# EAGLE design team throttle control (EAGLE 9.6.2)
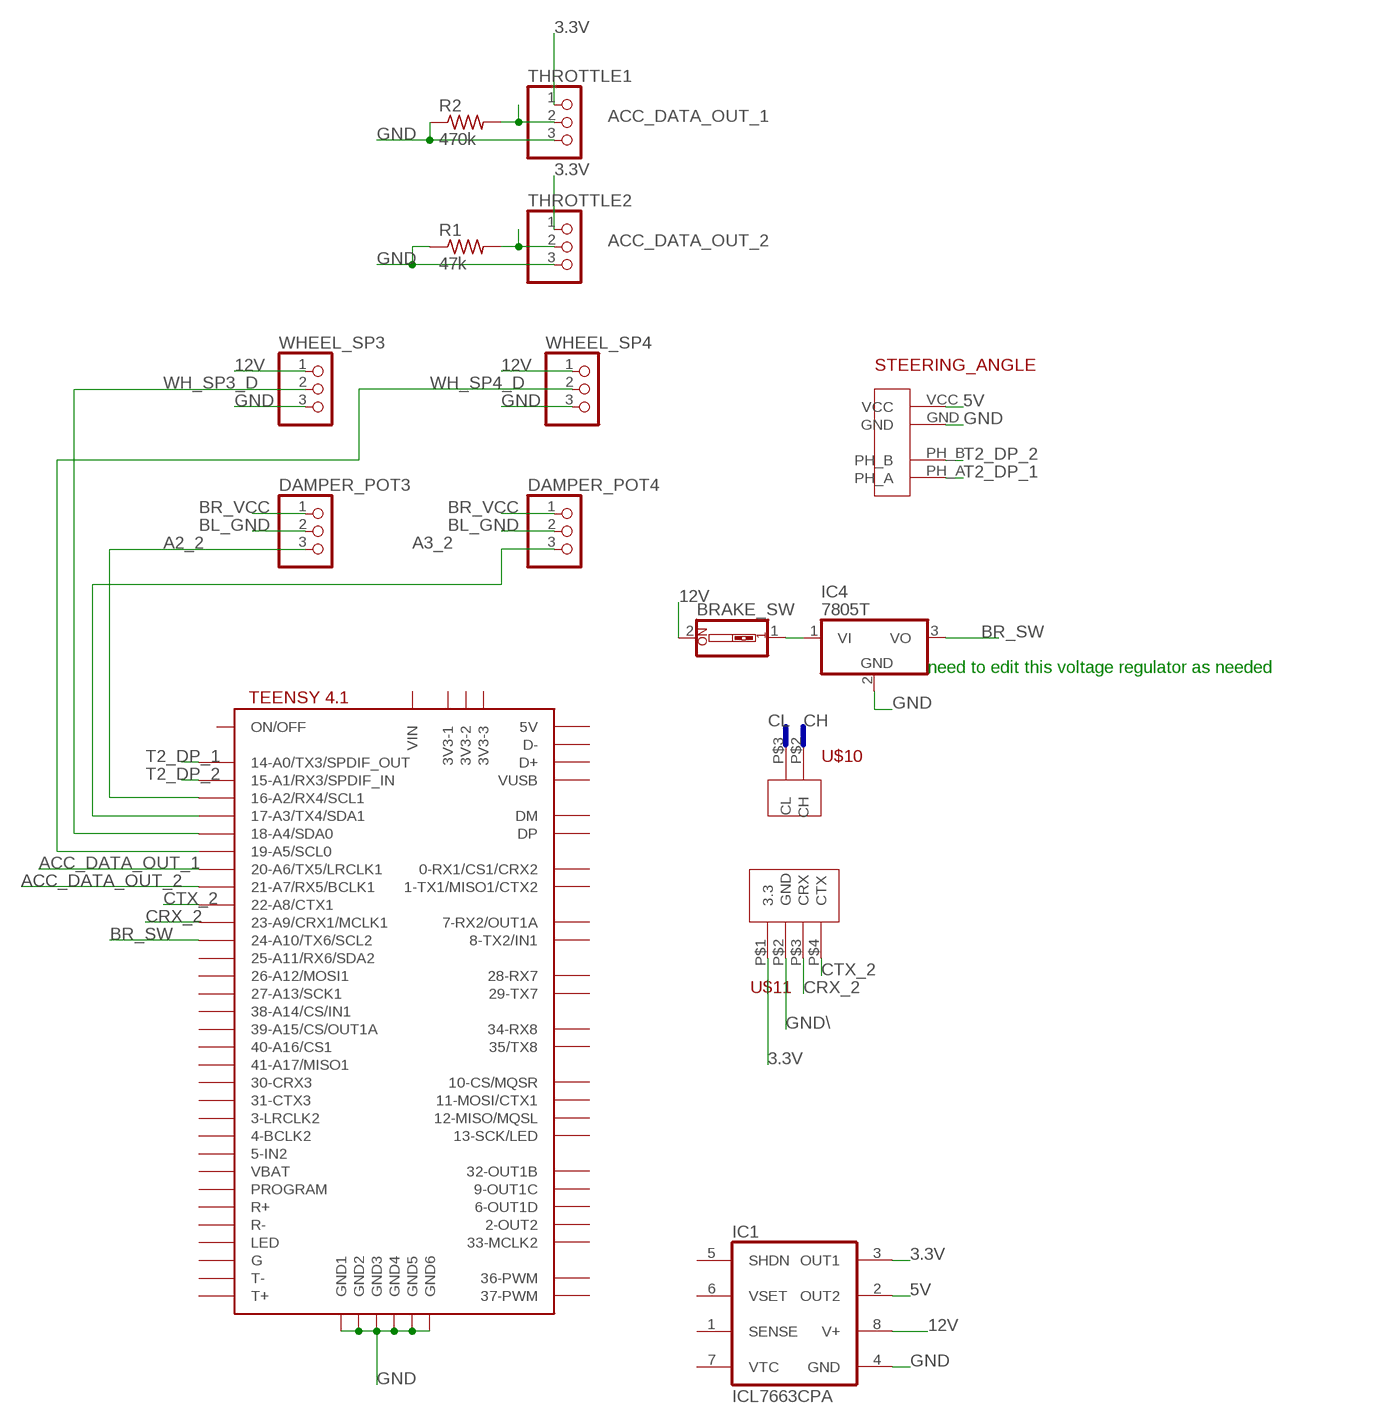
[diagram p0: schematic, sheet 1]

## Parts
BRAKE_SW  SW_DIP-1  [EDG-01]
DAMPER_POT3  PINHD-1X3CB  [1X03-CLEANBIG]
DAMPER_POT4  PINHD-1X3CB  [1X03-CLEANBIG]
IC1  ICL7663CPA  [DIL08]
IC4  7805T  [TO220H]
R1  47k  R-US_0204/7  [0204/7]
R2  470k  R-US_0204/7  [0204/7]
STEERING_ANGLE  ROTARY_ENCODER  [ROTARY_ENCODER]
THROTTLE1  PINHD-1X3  [1X03]
THROTTLE2  PINHD-1X3  [1X03]
U$3  TEENSY41  [TEENSY41]
U$10  CAN_BUS  [CAN_BUS]
U$11  CAN_TEE  [CAN_TEN]
WHEEL_SP3  PINHD-1X3  [1X03]
WHEEL_SP4  PINHD-1X3  [1X03]

## Nets
3.3V: IC1.3(OUT1) THROTTLE1.1 THROTTLE2.1 U$11.P$1(3.3)
5V: IC1.2(OUT2) STEERING_ANGLE.VCC
12V: BRAKE_SW.2 IC1.8(V+) WHEEL_SP3.1 WHEEL_SP4.1
A2_2: DAMPER_POT3.3 U$3.16-A2/RX4/SCL1
A3_2: DAMPER_POT4.3 U$3.17-A3/TX4/SDA1
ACC_DATA_OUT_1: R2.2 THROTTLE1.2 U$3.20-A6/TX5/LRCLK1
ACC_DATA_OUT_2: R1.2 THROTTLE2.2 U$3.21-A7/RX5/BCLK1
BL_GND: DAMPER_POT3.2 DAMPER_POT4.2
BR_SW: IC4.3(VO) U$3.24-A10/TX6/SCL2
BR_VCC: DAMPER_POT3.1 DAMPER_POT4.1
CRX_2: U$3.23-A9/CRX1/MCLK1 U$11.P$3(CRX)
CTX_2: U$3.22-A8/CTX1 U$11.P$4(CTX)
GND: IC1.4(GND) IC4.2(GND) R1.1 R2.1 STEERING_ANGLE.GND THROTTLE1.3 THROTTLE2.3 U$3.GND1 U$3.GND2 U$3.GND3 U$3.GND4 U$3.GND5 U$3.GND6 WHEEL_SP3.3 WHEEL_SP4.3
GND\: U$11.P$2(GND)
N$4: BRAKE_SW.1 IC4.1(VI)
T2_DP_1: STEERING_ANGLE.PH_A U$3.14-A0/TX3/SPDIF_OUT
T2_DP_2: STEERING_ANGLE.PH_B U$3.15-A1/RX3/SPDIF_IN
WH_SP3_D: U$3.18-A4/SDA0 WHEEL_SP3.2
WH_SP4_D: U$3.19-A5/SCL0 WHEEL_SP4.2
Unconnected: IC1.1(SENSE) IC1.5(SHDN) IC1.6(VSET) IC1.7(VTC) U$3.0-RX1/CS1/CRX2 U$3.1-TX1/MISO1/CTX2 U$3.2-OUT2 U$3.3-LRCLK2 U$3.3V3-1 U$3.3V3-2 U$3.3V3-3 U$3.4-BCLK2 U$3.5-IN2 U$3.6-OUT1D U$3.7-RX2/OUT1A U$3.8-TX2/IN2(8-TX2/IN1) U$3.9-OUT1C U$3.10-CS\MQSR(10-CS/MQSR) U$3.11-MOSI/CTX1 U$3.12-MISO/MQSL U$3.13-SCK/LED U$3.25-A11/RX6/SDA2 U$3.26-A12/MOSI1 U$3.27-A13/SCK1 U$3.28-RX7 U$3.29-TX7 U$3.30-CRX3 U$3.31-CTX3 U$3.32-OUT1B U$3.33-MCLK2 U$3.34-RX8 U$3.35-TX8(35/TX8) U$3.36-PWM U$3.37-PWM U$3.38-A14/CS/IN1 U$3.39-A15/CS/OUT1A U$3.40-A16/CS1 U$3.41-A17/MISO1 U$3.+5V(5V) U$3.D+ U$3.D- U$3.DM U$3.DP U$3.G U$3.LED U$3.ON/OFF U$3.PROGRAM U$3.R+ U$3.R- U$3.T+ U$3.T- U$3.VBAT U$3.VIN U$3.VUSB U$10.P$2(CH) U$10.P$3(CL)

## Buses
CL
CH

## Notes on the sheet
- need to edit this voltage regulator as needed

## Library data of the parts
BRAKE_SW = special:SW_DIP-1: DIP SWITCH
DAMPER_POT3 DAMPER_POT4 THROTTLE1 THROTTLE2 WHEEL_SP3 WHEEL_SP4 = adafruit:PINHD-1X3: PIN HEADER
IC1 = maxim:ICL7663CPA: Positive VOLTAGE REGULATOR; OC_FARNELL: unknown; OC_NEWARK: unknown
IC4 = adafruit:78*: Positive VOLTAGE REGULATOR Added bigger pads to the TO-92 package
R1 R2 = rcl:R-US_: RESISTOR, American symbol; SPICEPREFIX: R
STEERING_ANGLE = F-E library custom components:ROTARY_ENCODER
U$3 = teensy:TEENSY41
U$10 = F-E library custom components:CAN_BUS
U$11 = F-E library custom components:CAN_TEE

## Board
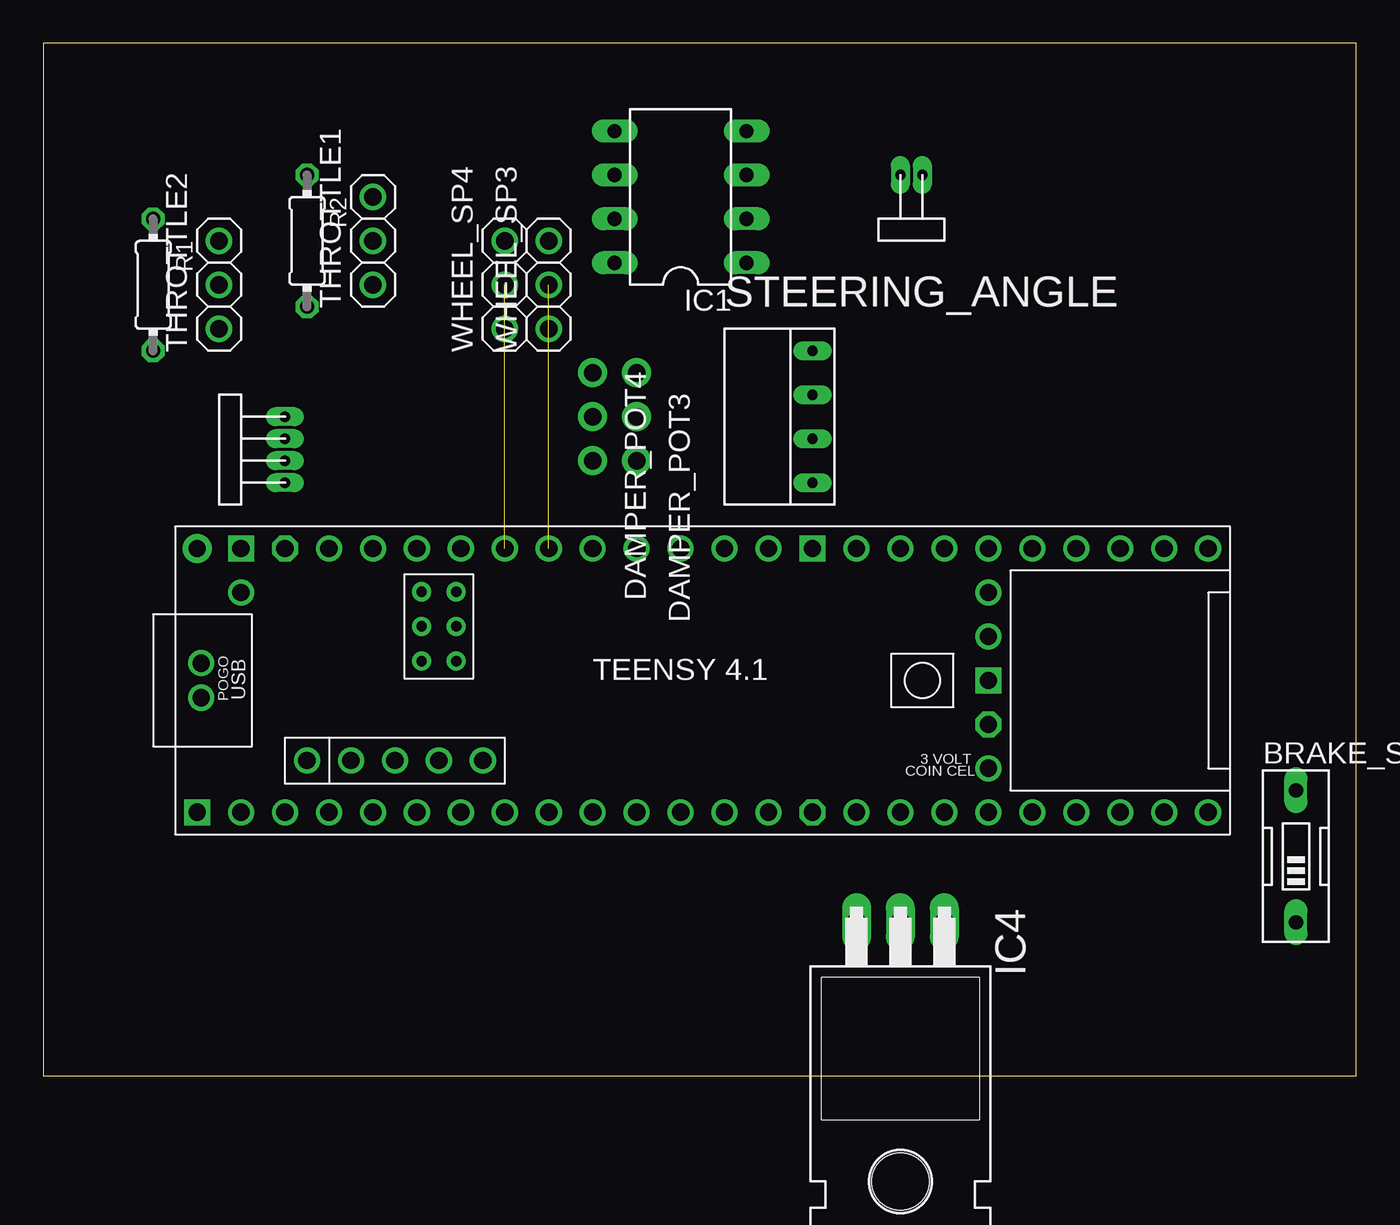
[diagram p1: board, top side]
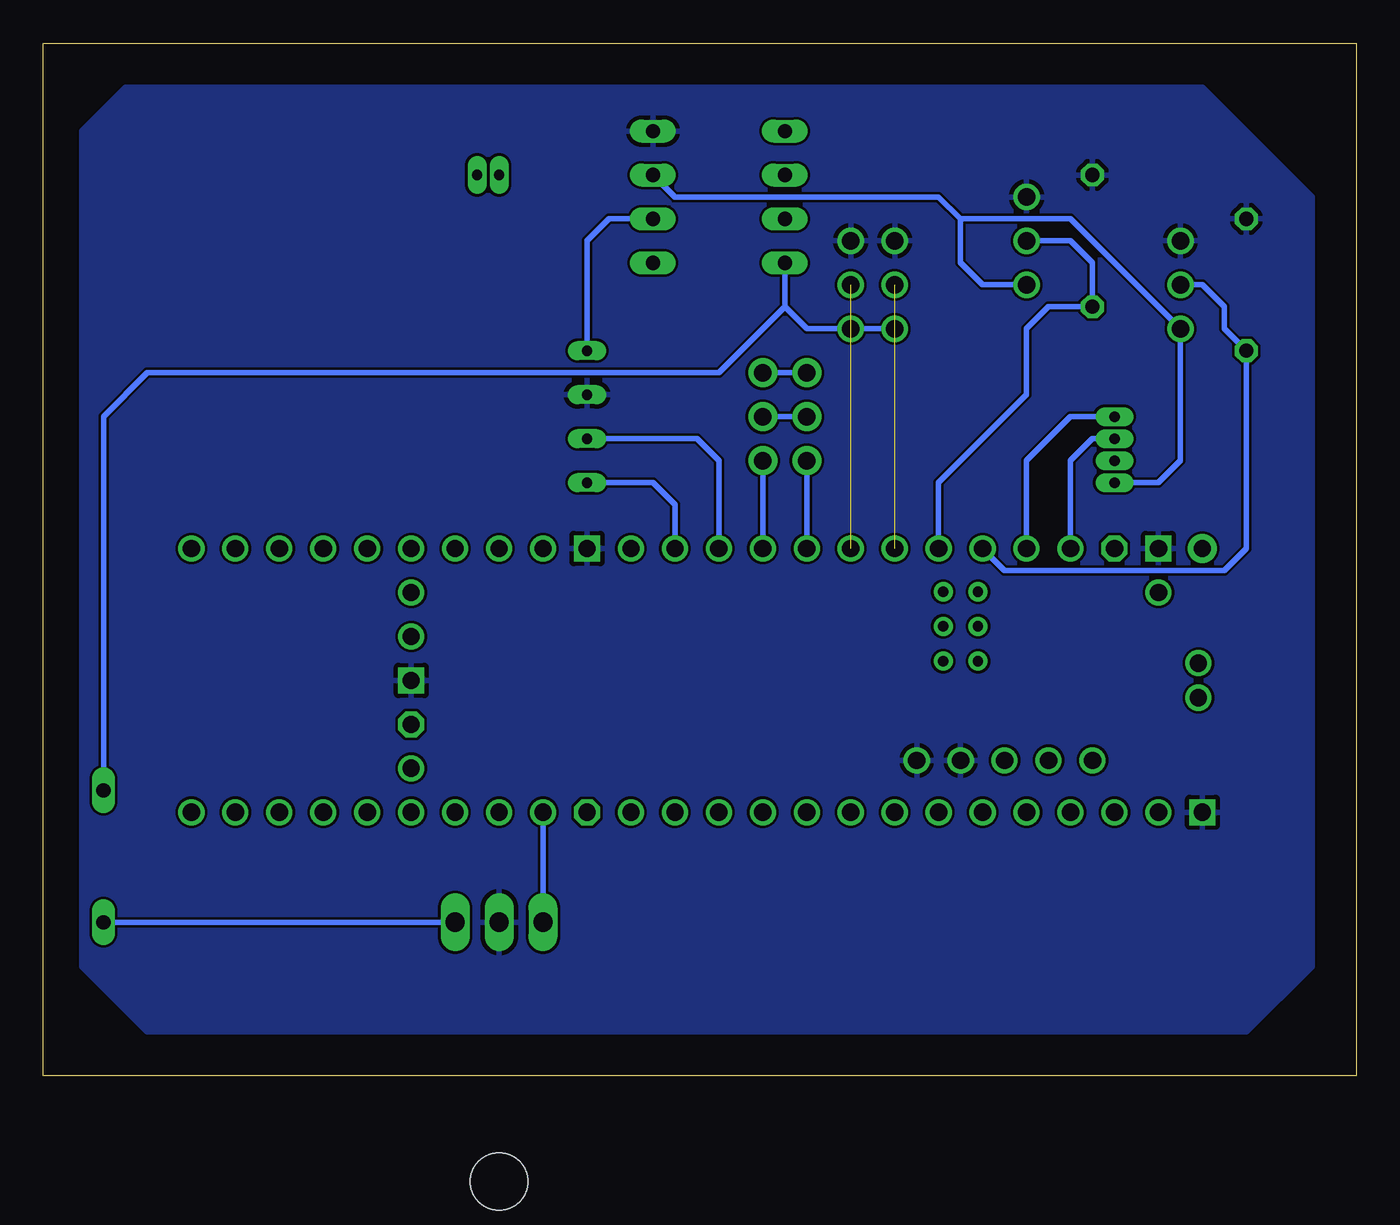
[diagram p2: board, bottom side, seen from below]

Size 75.87 x 59.68 mm. Coordinates in mm from the lower left corner, seen from the top.
Outline: 0,0 75.87,0 75.87,59.68 0,59.68 0,0
Copper layers (1*16): Top 0.035mm / dielectric 1.5mm / Bottom 0.035mm
Design rules "default": minimum track width 6mil, minimum drill 0.35mm, track to track 6mil, track to pad 6mil, pad to pad 6mil, via to via 6mil, smd to smd 6mil, copper to edge 40mil, drill to drill 6mil, minimum pad ring 10mil, minimum via ring 8mil, stop-mask expansion 4mil, vias tented up to drill 0mil, thermal gap 10mil

### Footprints (pad centres in the part's own frame; a part is rotated, then mirrored left to right if it is on the bottom)
EDG-01 = drill 0.813 long: 1 0,-3.81; 2 0,3.81
1X03-CLEANBIG = drill 1.016 pad 1.676: 1 -2.54,0; 2 0,0; 3 2.54,0
DIL08 = drill 0.813 long: 1 -3.81,-3.81; 2 -1.27,-3.81; 3 1.27,-3.81; 4 3.81,-3.81; 5 3.81,3.81; 6 1.27,3.81; 7 -1.27,3.81; 8 -3.81,3.81
TO220H = drill 1.118 long: 1 -2.54,-10.16; 2 0,-10.16; 3 2.54,-10.16 | hole 3.302: 0,4.826
0204/7 = drill 0.813 octagon: 1 -3.81,0; 2 3.81,0
ROTARY_ENCODER = drill 0.6 long: GND 1.27,1.27; PH_A 1.27,-3.81; PH_B 1.27,-1.27; VCC 1.27,3.81
1X03 = drill 1.016: 1 -2.54,0; 2 0,0; 3 2.54,0
TEENSY41 = drill 1: 0-RX1/CS1/CRX2 -27.94,-7.62; 1-TX1/MISO1/CTX2 -25.4,-7.62; 2-OUT2 -22.86,-7.62; 3-LRCLK2 -20.32,-7.62; 4-BCLK2 -17.78,-7.62; 5-IN2 -15.24,-7.62; 6-OUT1D -12.7,-7.62; 7-RX2/OUT1A -10.16,-7.62; 8-TX2/IN2 -7.62,-7.62; 9-OUT1C -5.08,-7.62; 10-CS\MQSR -2.54,-7.62; 11-MOSI/CTX1 0,-7.62; 12-MISO/MQSL 2.54,-7.62; 13-SCK/LED 2.54,7.62; 14-A0/TX3/SPDIF_OUT 0,7.62; 15-A1/RX3/SPDIF_IN -2.54,7.62; 16-A2/RX4/SCL1 -5.08,7.62; 17-A3/TX4/SDA1 -7.62,7.62; 18-A4/SDA0 -10.16,7.62; 19-A5/SCL0 -12.7,7.62; 20-A6/TX5/LRCLK1 -15.24,7.62; 21-A7/RX5/BCLK1 -17.78,7.62; 22-A8/CTX1 -20.32,7.62; 23-A9/CRX1/MCLK1 -22.86,7.62; 24-A10/TX6/SCL2 7.62,-7.62; 25-A11/RX6/SDA2 10.16,-7.62; 26-A12/MOSI1 12.7,-7.62; 27-A13/SCK1 15.24,-7.62; 28-RX7 17.78,-7.62; 29-TX7 20.32,-7.62; 30-CRX3 22.86,-7.62; 31-CTX3 25.4,-7.62; 32-OUT1B 27.94,-7.62; 33-MCLK2 27.94,7.62; 34-RX8 25.4,7.62; 35-TX8 22.86,7.62; 36-PWM 20.32,7.62; 37-PWM 17.78,7.62; 38-A14/CS/IN1 15.24,7.62; 39-A15/CS/OUT1A 12.7,7.62; 40-A16/CS1 10.16,7.62; 41-A17/MISO1 7.62,7.62; +5V -24.13,-4.62; D+ -30.25,-1; D- -30.25,1; DM -21.59,-4.62; DP -19.05,-4.62; GND4 -16.51,-4.62; GND5 -13.97,-4.62; ON/OFF 15.24,5.08; PROGRAM 15.24,2.54; VBAT 15.24,-5.08; VUSB -27.94,5.08 | drill 1 octagon: 3V3-1 5.08,-7.62; 3V3-2 15.24,-2.54; 3V3-3 -25.4,7.62 | drill 0.6: G -15.51,3.12; LED -17.51,3.12; R+ -17.51,5.12; R- -15.51,5.12; T+ -15.51,1.12; T- -17.51,1.12 | drill 1 square: GND1 -30.48,-7.62; GND2 15.24,0; GND3 5.08,7.62; GND6 -27.94,7.62 | drill 1 pad 1.676: VIN -30.48,7.62
CAN_BUS = drill 0.6 long: P$2 3.81,2.54; P$3 5.08,2.54
CAN_TEN = drill 0.6 long: P$1 2.54,1.27; P$2 3.81,1.27; P$3 5.08,1.27; P$4 6.35,1.27

### Placement (x,y rotation side)
BRAKE_SW  72.39,12.7 0 top
DAMPER_POT3  34.29,38.1 270 top
DAMPER_POT4  31.75,38.1 270 top
IC1  36.83,50.8 90 top
IC4  49.53,-1.27 180 top
R1  6.35,45.72 270 top
R2  15.24,48.26 270 top
STEERING_ANGLE  43.18,38.1 0 top
THROTTLE1  19.05,48.26 90 top
THROTTLE2  10.16,45.72 90 top
U$3  39.37,22.86 0 top
U$10  54.61,54.61 180 top
U$11  15.24,31.75 90 top
WHEEL_SP3  29.21,45.72 90 top
WHEEL_SP4  26.67,45.72 90 top

### Tracks (layer width: path | path; a pad name or v marks a point on that pad's centre or on a via)
3.3V
  Bottom 0.305: U$11.P$1 11.43,34.29 10.16,35.56 THROTTLE2.1 16.51,49.53 22.86,49.53 | IC1.3 39.37,50.8 24.13,50.8 22.86,49.53 | 22.86,49.53 22.86,46.99 21.59,45.72 THROTTLE1.1
5V
  Bottom 0.305: IC1.2 43.18,49.53 44.45,48.26 STEERING_ANGLE.VCC
12V
  Bottom 0.305: WHEEL_SP4.1 WHEEL_SP3.1 31.75,43.18 33.02,44.45 | IC1.8 33.02,44.45 | 33.02,44.45 36.83,40.64 69.85,40.64 72.39,38.1 BRAKE_SW.2
A2_2
  Bottom 0.305: DAMPER_POT3.3 U$3.16-A2/RX4/SCL1
A3_2
  Bottom 0.305: DAMPER_POT4.3 U$3.17-A3/TX4/SDA1
ACC_DATA_OUT_1
  Bottom 0.305: U$3.20-A6/TX5/LRCLK1 24.13,34.29 19.05,39.37 19.05,43.18 17.78,44.45 R2.2 15.24,46.99 16.51,48.26 THROTTLE1.2
ACC_DATA_OUT_2
  Bottom 0.305: THROTTLE2.2 8.89,45.72 7.62,44.45 7.62,43.18 R1.2 6.35,30.48 7.62,29.21 20.32,29.21 U$3.21-A7/RX5/BCLK1
BL_GND
  Bottom 0.305: DAMPER_POT4.2 DAMPER_POT3.2
BR_SW
  Bottom 0.305: IC4.3 U$3.24-A10/TX6/SCL2
BR_VCC
  Bottom 0.305: DAMPER_POT4.1 DAMPER_POT3.1
CRX_2
  Bottom 0.305: U$11.P$3 15.24,36.83 16.51,35.56 U$3.23-A9/CRX1/MCLK1
CTX_2
  Bottom 0.305: U$11.P$4 16.51,38.1 19.05,35.56 U$3.22-A8/CTX1
GND
  pour Bottom: 2.54,50.8 2.54,6.35 6.35,2.54 69.85,2.54 73.66,6.35 73.66,54.61 71.12,57.15 8.89,57.15
N$4
  Bottom 0.305: IC4.1 BRAKE_SW.1
T2_DP_1
  Bottom 0.305: STEERING_ANGLE.PH_A 40.64,34.29 39.37,33.02 U$3.14-A0/TX3/SPDIF_OUT
T2_DP_2
  Bottom 0.305: STEERING_ANGLE.PH_B 38.1,36.83 36.83,35.56 U$3.15-A1/RX3/SPDIF_IN
WH_SP3_D  (1 unrouted)
WH_SP4_D  (1 unrouted)